# Altium project RF_Tetra.PrjPcb (part 3 of 7)

## Sheet CLOC_DISTR.SchDoc: Clock distributions
size A3; SheetNumber: 4; SheetTotal: 17
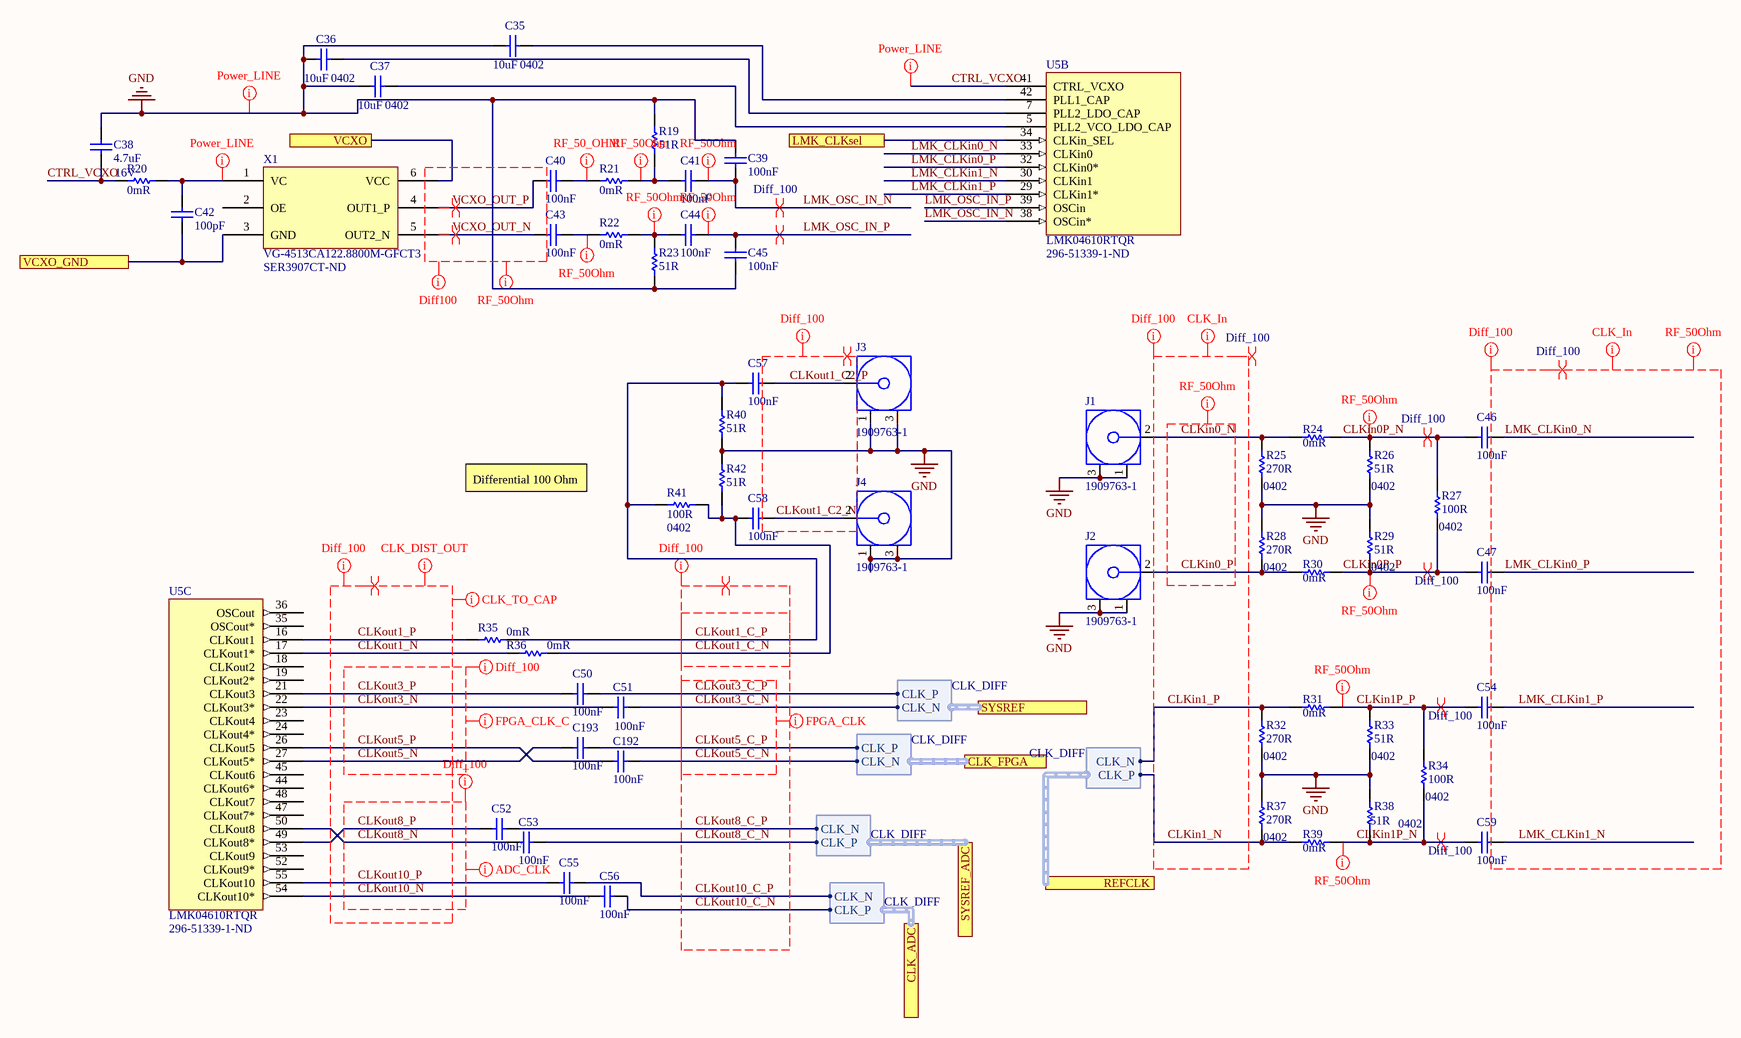
[diagram p4: CLOC_DISTR.SchDoc]

### Parts
C35  10uF  Case/Package: 0402  [CAP 0402/1005 RF KK]
C36  10uF  Case/Package: 0402  [CAP 0402/1005 RF KK]
C37  10uF  Case/Package: 0402  [CAP 0402/1005 RF KK]
C38  4.7uF  Voltage: 16V  [CAP 0603/1608 RF]
C39  100nF  [CAP 0201/0603 KK]
C40  100nF  [CAP 0201/0603 KK]
C41  100nF  [CAP 0201/0603 KK]
C42  100pF  [CAP 0402/1005 RF KK]
C43  100nF  [CAP 0201/0603 KK]
C44  100nF  [CAP 0201/0603 KK]
C45  100nF  [CAP 0201/0603 KK]
C46  100nF  [CAP 0201/0603 KK]
C47  100nF  [CAP 0201/0603 KK]
C50  100nF  [CAP 0201/0603 KK]
C51  100nF  [CAP 0201/0603 KK]
C52  100nF  [CAP 0201/0603 KK]
C53  100nF  [CAP 0201/0603 KK]
C54  100nF  [CAP 0201/0603 KK]
C55  100nF  [CAP 0201/0603 KK]
C56  100nF  [CAP 0201/0603 KK]
C57  100nF  [CAP 0201/0603 KK]
C58  100nF  [CAP 0201/0603 KK]
C59  100nF  [CAP 0201/0603 KK]
C192  100nF  [CAP 0201/0603 KK]
C193  100nF  [CAP 0201/0603 KK]
J1  1909763-1  [TECO-1909763-1_V]
J2  1909763-1  [TECO-1909763-1_V]
J3  1909763-1  [TECO-1909763-1_V]
J4  1909763-1  [TECO-1909763-1_V]
R19  51R  [RES 0402/1005 RF KK]
R20  0mR  [RES 0402/1005 RF KK]
R21  0mR  [RES 0402/1005 RF KK]
R22  0mR  [RES 0402/1005 RF KK]
R23  51R  [RES 0402/1005 RF KK]
R24  0mR  [RES 0402/1005 RF KK]
R25  270R  Case/Package: 0402  [RES 0402/1005 RF KK]
R26  51R  Case/Package: 0402  [RES 0402/1005 RF KK]
R27  100R  Case/Package: 0402  [RES 0402/1005 RF KK]
R28  270R  Case/Package: 0402  [RES 0402/1005 RF KK]
R29  51R  Case/Package: 0402  [RES 0402/1005 RF KK]
R30  0mR  [RES 0402/1005 RF KK]
R31  0mR  [RES 0402/1005 RF KK]
R32  270R  Case/Package: 0402  [RES 0402/1005 RF KK]
R33  51R  Case/Package: 0402  [RES 0402/1005 RF KK]
R34  100R  Case/Package: 0402  [RES 0402/1005 RF KK]
R35  0mR  [RES 0402/1005 RF KK]
R36  0mR  [RES 0402/1005 RF KK]
R37  270R  Case/Package: 0402  [RES 0402/1005 RF KK]
R38  51R  Case/Package: 0402  [RES 0402/1005 RF KK]
R39  0mR  [RES 0402/1005 RF KK]
R40  51R  [RES 0402/1005 RF KK]
R41  100R  Case/Package: 0402  [RES 0402/1005 RF KK]
R42  51R  [RES 0402/1005 RF KK]
U5  LMK04610RTQR  Supplier Part Number 1: 296-51339-1-ND  [LMK04610]  (parts B,C of 4)
X1  VG-4513CA122.8800M-GFCT3  Supplier Part Number 1: SER3907CT-ND  [VG-4513CA]

### Ports
CLK_ADC (harness CLK_DIFF), CLK_FPGA (harness CLK_DIFF), LMK_CLKsel, REFCLK (harness CLK_DIFF), SYSREF (harness CLK_DIFF), SYSREF_ADC (harness CLK_DIFF), VCXO, VCXO_GND

### Harnesses
CLK_DIFF: CLK_N, CLK_P
CLK_DIFF: CLK_P, CLK_N

### Nets
GND: C35.1 C36.1 C37.1 C38.2 C39.2 C45.1 J1.1 J1.3 J2.1 J2.3 J3.1 J3.3 J4.1 J4.3 R19.2 R23.1 R25.1 R26.1 R28.2 R29.2 R32.1 R33.1 R37.2 R38.2 R40.1 R42.1
CLKin0_N: J1.2 R24.1 R25.2
CLKin0_P: J2.2 R28.1 R30.1
CLKin0P_N: C46.2 R24.2 R26.2 R27.2
CLKin0P_P: C47.2 R27.1 R29.1 R30.2
CLKin1_N: R37.1 R39.1 ; port REFCLK.CLK_P
CLKin1_P: R31.1 R32.2 ; port REFCLK.CLK_N
CLKin1P_N: C59.2 R34.1 R38.1 R39.2
CLKin1P_P: C54.2 R31.2 R33.2 R34.2
CLKout1_C2_N: C58.1 J4.2
CLKout1_C2_P: C57.1 J3.2
CLKout1_C_N: C58.2 R36.2 R41.2 R42.2
CLKout1_C_P: C57.2 R35.2 R40.2 R41.1
CLKout1_N: R36.1 U5.17(CLKout1*)
CLKout1_P: R35.1 U5.16(CLKout1)
CLKout3_C_N: C51.1 ; port SYSREF.CLK_N
CLKout3_C_P: C50.1 ; port SYSREF.CLK_P
CLKout3_N: C51.2 U5.22(CLKout3*)
CLKout3_P: C50.2 U5.21(CLKout3)
CLKout5_C_N: C192.1 ; port CLK_FPGA.CLK_N
CLKout5_C_P: C193.1 ; port CLK_FPGA.CLK_P
CLKout5_N: C193.2 U5.27(CLKout5*)
CLKout5_P: C192.2 U5.26(CLKout5)
CLKout8_C_N: C53.1 ; port SYSREF_ADC.CLK_P
CLKout8_C_P: C52.1 ; port SYSREF_ADC.CLK_N
CLKout8_N: C53.2 U5.50(CLKout8)
CLKout8_P: C52.2 U5.49(CLKout8*)
CLKout10_C_N: C56.1 ; port CLK_ADC.CLK_P
CLKout10_C_P: C55.1 ; port CLK_ADC.CLK_N
CLKout10_N: C56.2 U5.54(CLKout10*)
CLKout10_P: C55.2 U5.55(CLKout10)
CTRL_VCXO: C38.1 R20.1 U5.41(CTRL_VCXO)
GND_VCXO: C42.1 X1.3(GND) ; port VCXO_GND
LMK_CLKin0_N: C46.1 U5.33(CLKin0)
LMK_CLKin0_P: C47.1 U5.32(CLKin0*)
LMK_CLKin1_N: C59.1 U5.30(CLKin1)
LMK_CLKin1_P: C54.1 U5.29(CLKin1*)
LMK_CLKsel: U5.34(CLKin_SEL) ; port LMK_CLKsel
LMK_OSC_IN_N: C39.1 C41.1 U5.38(OSCin*)
LMK_OSC_IN_P: C44.1 C45.2 U5.39(OSCin)
VCXO_OUT_N: C43.2 X1.5(OUT2_N)
VCXO_OUT_P: C40.2 X1.4(OUT1_P)
NetC35_2: C35.2 U5.42(PLL1_CAP)
NetC36_2: C36.2 U5.7(PLL2_LDO_CAP)
NetC37_2: C37.2 U5.5(PLL2_VCO_LDO_CAP)
NetC40_1: C40.1 R21.1
NetC41_2: C41.2 R19.1 R21.2
NetC42_2: C42.2 R20.2 X1.1(VC)
NetC43_1: C43.1 R22.1
NetC44_2: C44.2 R22.2 R23.2
NetC111_2: X1.6(VCC) ; port VCXO

Not connected (* = marked no-connect by the designer): U5 18(CLKout2) 19(CLKout2*) 23(CLKout4) 24(CLKout4*) 35(OSCout*) 36(OSCout) 44(CLKout6*) 45(CLKout6) 47(CLKout7*) 48(CLKout7) 52(CLKout9*) 53(CLKout9); X1 2(OE)

### Layout directives
differential pair; differential pair class Diff_100: CLKin0_N, CLKin0_P, CLKin0P_N, CLKin0P_P, CLKin1_N, CLKin1_P, CLKin1P_N, CLKin1P_P, CLKout1_C2_N, CLKout1_C2_P, CLKout1_C_N, CLKout1_C_P, CLKout1_N, CLKout1_P, CLKout3_C_N, CLKout3_C_P, CLKout3_N, CLKout3_P, CLKout5_C_N, CLKout5_C_P, CLKout5_N, CLKout5_P, CLKout8_C_N, CLKout8_C_P, CLKout8_N, CLKout8_P, CLKout10_C_N, CLKout10_C_P, CLKout10_N, CLKout10_P, LMK_CLKin0_N, LMK_CLKin0_P, LMK_CLKin1_N, LMK_CLKin1_P, LMK_OSC_IN_N, LMK_OSC_IN_P, VCXO_OUT_N, VCXO_OUT_P
net class CLK_In1: CLKin0_N, CLKin0_P, CLKin1_N, CLKin1_P
net class Single50: CLKin0_N, CLKin0_P, CLKin0P_N, CLKin0P_P, CLKin1P_N, CLKin1P_P, LMK_CLKin0_N, LMK_CLKin0_P, LMK_CLKin1_N, LMK_CLKin1_P, LMK_OSC_IN_N, LMK_OSC_IN_P, NetC40_1, NetC41_2, NetC43_1, NetC44_2, VCXO_OUT_N, VCXO_OUT_P
net class CLK_In2: LMK_CLKin0_N, LMK_CLKin0_P, LMK_CLKin1_N, LMK_CLKin1_P
net class Diff_100: CLKin0_N, CLKin0_P, CLKin1_N, CLKin1_P, CLKout1_C2_N, CLKout1_C2_P, CLKout1_C_N, CLKout1_C_P, CLKout1_N, CLKout1_P, CLKout3_C_N, CLKout3_C_P, CLKout3_N, CLKout3_P, CLKout5_C_N, CLKout5_C_P, CLKout5_N, CLKout5_P, CLKout8_C_N, CLKout8_C_P, CLKout8_N, CLKout8_P, CLKout10_C_N, CLKout10_C_P, CLKout10_N, CLKout10_P, LMK_CLKin0_N, LMK_CLKin0_P, LMK_CLKin1_N, LMK_CLKin1_P, VCXO_OUT_N, VCXO_OUT_P
net class Power_LINE: CTRL_VCXO, GND, NetC42_2
net class CLK_DIST_OUT: CLKout1_N, CLKout1_P, CLKout3_N, CLKout3_P, CLKout5_N, CLKout5_P, CLKout8_N, CLKout8_P, CLKout10_N, CLKout10_P
net class CLK_TO_CAP: CLKout1_N, CLKout1_P, CLKout3_N, CLKout3_P, CLKout5_N, CLKout5_P, CLKout8_N, CLKout8_P, CLKout10_N, CLKout10_P
net class FPGA_CLK: CLKout3_C_N, CLKout3_C_P, CLKout5_C_N, CLKout5_C_P
net class ADC_CLK: CLKout8_N, CLKout8_P, CLKout10_N, CLKout10_P
net class FPGA_CLK_C: CLKout3_N, CLKout3_P, CLKout5_N, CLKout5_P

### Notes on the sheet
- Differential 100 Ohm
- Title
- Size:
- Date:
- A3
- Number:
- Time:
- Revision:
- Sheet
- of
- File:

### Library data of the parts
C35-C37 = Capacitor: CAP CER 10UF 6.3V X5R 0402; Manufacturer: Murata; Manufacturer Part Number: GRJ155R60J106ME11D; Tolerance: 20%; Supplier 1: Digi-Key; Supplier Part Number 1: 490-13211-1-ND; RoHS: Yes; Category: Ceramic Capacitors; Stock 1: 1136490; Pricing 1: 1=0,21000, 10=0,14500, 50=0,08680, 100=0,07330, 500=0,05016, 1000=0,04436, 2500=0,04244, 5000=0,03858 (USD); Mount: Surface Mount; Case Code (Metric): 1005; Case Code (Imperial): 0402; Min Operating Temperature: -55°C; Max Operating Temperature: 85°C; Packaging: Cut Tape; Capacitance: 10uF; Voltage Rating: 6.3V; Features: Soft Termination; Length: 0.039inch; Width: 0.02inch; Thickness: 0.028inch; ComponentLink1URL: http://psearch.en.murata.com/capacitor/product/GRJ155R60J106ME11%23.pdf?src-supplier=Digi-Key; ComponentLink1Description: http://psearch.en.murata.com/capacitor/product/GRJ155R60J106ME11%23.pdf?src-supplier=Digi-Key
C38 = Capacitor: TAIYO YUDEN - EMK107ABJ475MA-T - SMD Multilayer Ceramic Capacitor, 4.7 µF, 16 V, 0603 [1608 Metric], ± 20%, X5R, M Series; Supplier 1: Digi-Key; Supplier Part Number 1: 587-6003-1-ND; Manufacturer: Taiyo Yuden; Manufacturer Part Number: EMK107ABJ475MA-T; RoHS: Yes; Category: Ceramic Capacitors; Stock 1: 5; Pricing 1: 1=0,28000, 10=0,19200, 50=0,12820, 100=0,10900, 500=0,07696, 1000=0,06734 (USD); Mount: Surface Mount; Case/Package: Ceramic; Min Operating Temperature: -55°C; Max Operating Temperature: 85°C; Capacitance: 4.7uF; Tolerance: 20%; Packaging: Tape and Reel; Dielectric: X5R; Length: 1.6mm; Height: 0.8mm; Depth: 0.8mm; Radiation Hardening: No; Lead Free: Lead Free; ComponentLink1URL: https://datasheet.ciiva.com/26871/getdatasheetpartid-637315-26871304.pdf?src-supplier=Verical; ComponentLink1Description: https://datasheet.ciiva.com/26871/getdatasheetpartid-637315-26871304.pdf?src-supplier=Verical
C39 C45 = Capacitor: Manufacturer 1: Yageo; Manufacturer Part Number 1: CC0201KRX5R6BB104; Voltage Rating (DC): 10V; Tolerance: 10%; Dielectric: X5R; Supplier 1: Digi-Key; Supplier Part Number 1: 311-1593-1-ND; Stock 1: 1229391; Pricing 1: 1=0.10000, 10=0.03800, 100=0.01690, 500=0.01208, 1000=0.00949, 2500=0.00862, 5000=0.00794 (USD); RoHS: Yes; Mount: Surface Mount; Case/Package: 0201; Weight: 6E-06oz; Case Code (Imperial): 0201; Case Code (Metric): 0603; Min Operating Temperature: -55°C; Max Operating Temperature: 85°C; Capacitance: 100nF; Packaging: Tape and Reel; Termination: SMD/SMT; Composition: Ceramic; Voltage Rating: 10V; Length: 0.6mm; Height: 0.3mm; Width: 0.012inch; Thickness: 0.013inch; Depth: 0.3mm; Radiation Hardening: No; Lead Free: Lead Free; Halogen Free: Halogen Free; ComponentLink1URL: https://datasheet.ciiva.com/17437/upy-gphc-x5r-4v-to-50v-12-17437495.pdf?src-supplier=Avnet+Europe; ComponentLink1Description: https://datasheet.ciiva.com/17437/upy-gphc-x5r-4v-to-50v-12-17437495.pdf?src-supplier=Avnet+Europe; ComponentLink2URL: https://datasheet.ciiva.com/11587/upy-gphc-x5r-4v-to-50v-12-11587190.pdf?src-supplier=Avnet; ComponentLink2Description: https://datasheet.ciiva.com/11587/upy-gphc-x5r-4v-to-50v-12-11587190.pdf?src-supplier=Avnet
C40 C41 C43 C44 C46 C47 C50-C59 C192 C193 = Capacitor: Manufacturer 1: Murata; Manufacturer Part Number 1: GRM033R61C104ME84D; Voltage Rating: 16V; Tolerance: 20%; Dielectric: X5R; Supplier 1: Digi-Key; Supplier Part Number 1: 490-9986-1-ND; Stock 1: 503570; Pricing 1: 1=0.10000, 10=0.05400, 100=0.02430, 500=0.01732, 1000=0.01361, 2500=0.01238, 5000=0.01139 (USD); RoHS: Yes; Mount: Surface Mount; Case/Package: 0201; Weight: 1.2E-05oz; Case Code (Metric): 0603; Case Code (Imperial): 0201; Min Operating Temperature: -55°C; Max Operating Temperature: 85°C; Capacitance: 100nF; Packaging: Tape and Reel; Termination: SMD/SMT; Voltage Rating (DC): 16V; Package Quantity: 15000; Length: 0.024inch; Height: 0.3mm; Width: 0.3mm; Thickness: 0.013inch; ComponentLink1URL: http://www.mouser.com/ds/2/281/c02e-2905.pdf?src-supplier=Mouser; ComponentLink1Description: http://www.mouser.com/ds/2/281/c02e-2905.pdf?src-supplier=Mouser; ComponentLink2URL: http://search.murata.co.jp/Ceramy/image/img/A01X/G101/ENG/GRM033R61C104ME84-01.pdf?src-supplier=Digi-Key; ComponentLink2Description: http://search.murata.co.jp/Ceramy/image/img/A01X/G101/ENG/GRM033R61C104ME84-01.pdf?src-supplier=Digi-Key
C42 = Capacitor: Manufacturer 1: KEMET; Manufacturer Part Number 1: C0402C101J5GACAUTO; Dielectric Material: Ceramic; Tolerance: 5%; Voltage Rating: 50V; Dielectric: C0G; Supplier 1: Digi-Key; Supplier Part Number 1: 399-6823-1-ND; Stock 1: 66452; Pricing 1: 1=0.11000, 10=0.08400, 100=0.03730, 500=0.02664, 1000=0.02093, 2500=0.01903, 5000=0.01751 (USD); RoHS: Yes; Mount: Surface Mount; Case/Package: 0402; Case Code (Metric): 1005; Case Code (Imperial): 0402; Min Operating Temperature: -55°C; Max Operating Temperature: 125°C; Package Quantity: 10000; Capacitance: 100pF; Packaging: Tape and Reel; Voltage Rating (DC): 50V; Length: 1mm; Width: 0.02inch; Thickness: 0.022inch; Depth: 0.5mm; Ratings: AEC-Q200; Radiation Hardening: No; REACH SVHC: No SVHC; Lead Free: Lead Free; ComponentLink1URL: https://datasheet.ciiva.com/26923/getdatasheetpartid-385375-26923866.pdf?src-supplier=Verical; ComponentLink1Description: https://datasheet.ciiva.com/26923/getdatasheetpartid-385375-26923866.pdf?src-supplier=Verical
J1-J4 = 1909763-1: Ultra Miniature Coaxial Connector Jack, 60 V, 50 Ohm, -40 to 90 degC, RoHS, Tape and Reel; Brand: TE Connectivity / AMP; Maximum Frequency: 6 GHz; Gender: Jack (Female); Body Material: Liquid Crystal Polymer (LCP); RF Series: UMCC; Impedance: 50 Ohms; DatasheetVersion: Rev. B2; PackageReference: SMD; PackageDescription: 3-Pin Surface Mount Device, Body 2.6 x 2.6 mm; Supplier 1: Newark; Supplier Part Number 1: 62X0488; Supplier 2: Farnell; Supplier Part Number 2: 2781689; Supplier 3: Digi-Key; Supplier Part Number 3: A118077TR-ND; Supplier 4: Digi-Key; Supplier Part Number 4: A118077CT-ND; Supplier 5: Digi-Key; Supplier Part Number 5: A118077DKR-ND; Product Category: RF Connectors / Coaxial Connectors; Packaging: Reel; Product: Connectors; Orientation: Straight; Operating Temperature Range: - 40 C to + 90 C; Factory Pack Quantity: 5000; RoHS: Details; Contact Plating: Gold; Contact Material: Copper Alloy; Mounting Technology: Surface Mount; ComponentLink1Description: Manufacturer URL; ComponentLink1URL: http://www.te.com; ComponentLink2Description: Datasheet; ComponentLink2URL: http://www.te.com/commerce/DocumentDelivery/DDEController?Action=srchrtrv&DocNm=1909763&DocType=Customer+Drawing&DocLang=English
R19 R23 R40 R42 = Resistor: Manufacturer 1: Susumu; Manufacturer Part Number 1: RR0510R-510-D; Tolerance: 0.5%; Power Rating: 63mW; Voltage Rating: 25V; Temperature Coefficient: 100ppm/°C; Supplier 1: Digi-Key; Supplier Part Number 1: RR05R51DCT-ND; Stock 1: 85168; Pricing 1: 1=0.10000, 10=0.07400, 100=0.02850, 1000=0.01254, 2500=0.01083, 5000=0.00969 (USD); RoHS: Yes; Case/Package: 0402; Number of Pins: 2; Case Code (Metric): 1005; Case Code (Imperial): 0402; Min Operating Temperature: -55°C; Max Operating Temperature: 125°C; Resistance: 51R; Package Quantity: 1; Packaging: Tape and Reel; Composition: Thin Film; Number of Terminations: 2; Termination: SMD/SMT; Max Power Dissipation: 63mW; Voltage Rating (DC): 25V; Length: 0.039inch; Height: 0.016inch; Width: 0.02inch; REACH SVHC: Unknown; Lead Free: Lead Free; ComponentLink1URL: https://datasheet.ciiva.com/2486/rr-data-sheet-2486920.pdf?src-supplier=Digi-Key; ComponentLink1Description: https://datasheet.ciiva.com/2486/rr-data-sheet-2486920.pdf?src-supplier=Digi-Key; ComponentLink2URL: https://datasheet.ciiva.com/2486/rr-data-sheet-2486921.pdf?src-supplier=Digi-Key; ComponentLink2Description: https://datasheet.ciiva.com/2486/rr-data-sheet-2486921.pdf?src-supplier=Digi-Key; ComponentLink3URL: https://datasheet.ciiva.com/2486/rr-data-sheet-2486922.pdf?src-supplier=Digi-Key; ComponentLink3Description: https://datasheet.ciiva.com/2486/rr-data-sheet-2486922.pdf?src-supplier=Digi-Key; ComponentLink4URL: https://datasheet.ciiva.com/28635/87330-28635919.pdf?src-supplier=Element14; ComponentLink4Description: https://datasheet.ciiva.com/28635/87330-28635919.pdf?src-supplier=Element14
R20-R22 R24 R30 R31 R35 R36 R39 = Resistor: YAGEO - RC0402JR-070RL. - RES, THICK FILM, 0R, 0.0625W, 0402; Power Rating: 62.5mW; Tolerance: 5%; Voltage Rating: 50V; Max Power Dissipation: 63mW; Temperature Coefficient: 200ppm/°C; Supplier 1: Digi-Key; Supplier Part Number 1: 311-0.0JRCT-ND; Manufacturer: Yageo; Manufacturer Part Number: RC0402JR-070RL; RoHS: Yes; Category: Chip SMD Resistors; Stock 1: 45338179; Pricing 1: 1=0,10000, 10=0,01200, 25=0,00920, 50=0,00680, 100=0,00510, 250=0,00388, 500=0,00310, 1000=0,00228, 5000=0,00163 (USD); Case/Package: 0402; Case Code (Metric): 1005; Case Code (Imperial): 0402; Contact Plating: Tin,Matte; Min Operating Temperature: -55°C; Max Operating Temperature: 155°C; Package Quantity: 1; Resistance: 0mR; Packaging: Tape and Reel; Resistor Type: Thick Film; Number of Terminations: 2; Termination: SMD/SMT; Features: Moisture Resistant; Length: 1mm; Height: 0.016inch; Width: 0.02inch; Depth: 0.5mm; Radiation Hardening: No; REACH SVHC: Unknown; Military Standard: Not; Lead Free: Lead Free; ComponentLink1URL: https://datasheet.ciiva.com/2452/pyu-rc0402-51-rohs-l-6-2452608.pdf?src-supplier=Digi-Key; ComponentLink1Description: https://datasheet.ciiva.com/2452/pyu-rc0402-51-rohs-l-6-2452608.pdf?src-supplier=Digi-Key; ComponentLink2URL: https://datasheet.ciiva.com/11808/0900766b80c66297-11808195.pdf?src-supplier=RSComponents; ComponentLink2Description: https://datasheet.ciiva.com/11808/0900766b80c66297-11808195.pdf?src-supplier=RSComponents; ComponentLink3URL: https://datasheet.ciiva.com/2452/pyu-r-int-thick-7-2452609.pdf?src-supplier=Digi-Key; ComponentLink3Description: https://datasheet.ciiva.com/2452/pyu-r-int-thick-7-2452609.pdf?src-supplier=Digi-Key; ComponentLink4URL: https://datasheet.ciiva.com/2452/pyu-r-int-thick-7-2452610.pdf?src-supplier=Digi-Key; ComponentLink4Description: https://datasheet.ciiva.com/2452/pyu-r-int-thick-7-2452610.pdf?src-supplier=Digi-Key; ComponentLink5URL: https://datasheet.ciiva.com/8896/pyu-rc0402-51-rohs-l-6-8896201.pdf?src-supplier=Avnet; ComponentLink5Description: https://datasheet.ciiva.com/8896/pyu-rc0402-51-rohs-l-6-8896201.pdf?src-supplier=Avnet; ComponentLink6URL: https://datasheet.ciiva.com/28386/pyu-rc0402-51-rohs-l-6-28386633.pdf?src-supplier=Avnet+Europe; ComponentLink6Description: https://datasheet.ciiva.com/28386/pyu-rc0402-51-rohs-l-6-28386633.pdf?src-supplier=Avnet+Europe; ComponentLink7URL: https://datasheet.ciiva.com/22747/1018594-22747515.pdf?src-supplier=Element14; ComponentLink7Description: https://datasheet.ciiva.com/22747/1018594-22747515.pdf?src-supplier=Element14; ComponentLink8URL: https://datasheet.ciiva.com/15189/getdatasheetpartid-326379-15189533.pdf?src-supplier=Verical; ComponentLink8Description: https://datasheet.ciiva.com/15189/getdatasheetpartid-326379-15189533.pdf?src-supplier=Verical
R25 R28 R32 R37 = Resistor: RESISTOR, METAL FILM, 270 OHM, 0.5%,0402; Manufacturer: Panasonic; Manufacturer Part Number: ERA-2AED271X; Temperature Coefficient: 25ppm/°C; Voltage Rating (DC): 25V; Max Power Dissipation: 63mW; Power Rating: 62.5mW; Supplier 1: Digi-Key; Supplier Part Number 1: P270DECT-ND; RoHS: Yes; Category: Chip SMD Resistors; Stock 1: 15767; Pricing 1: 1=0,21000, 10=0,17900, 100=0,07000, 1000=0,02930, 2500=0,02686, 5000=0,02442 (USD); Mount: Surface Mount; Contact Plating: Tin; Case Code (Imperial): 0402; Case Code (Metric): 1005; Min Operating Temperature: -55°C; Max Operating Temperature: 155°C; Features: Automotive AEC-Q200; Termination: SMD/SMT; Composition: Thin Film,Metal Film; Number of Terminations: 2; Resistance: 270R; Packaging: Tape and Reel; Tolerance: 0.5%; Package Quantity: 10000; Voltage Rating: 25V; Length: 0.039inch; Height: 0.016inch; Width: 0.02inch; Lead Free: Lead Free; REACH SVHC: No SVHC; ComponentLink1URL: https://datasheet.ciiva.com/9183/aoa0000ce26-9183624.pdf?src-supplier=Avnet; ComponentLink1Description: https://datasheet.ciiva.com/9183/aoa0000ce26-9183624.pdf?src-supplier=Avnet; ComponentLink2URL: https://datasheet.ciiva.com/46378/1776116-46378222.pdf?src-supplier=Element14; ComponentLink2Description: https://datasheet.ciiva.com/46378/1776116-46378222.pdf?src-supplier=Element14
R26 R29 R33 R38 = Resistor: RES SMD 51 OHM 0.5% 1/16W 0402; Manufacturer: Panasonic; Manufacturer Part Number: ERA-2AED510X; Temperature Coefficient: 25ppm/°C; Power Rating: 62.5mW; Max Power Dissipation: 63mW; Supplier 1: Digi-Key; Supplier Part Number 1: P51DECT-ND; RoHS: Yes; Category: Chip SMD Resistors; Stock 1: 20961; Pricing 1: 1=0,21000, 10=0,17900, 100=0,07000, 1000=0,02930, 2500=0,02686, 5000=0,02442 (USD); Mount: Surface Mount; Case Code (Metric): 1005; Case Code (Imperial): 0402; Contact Plating: Tin; Min Operating Temperature: -55°C; Max Operating Temperature: 155°C; Features: Automotive AEC-Q200; Resistance: 51R; Tolerance: 0.5%; Packaging: Tape and Reel; Package Quantity: 1; Composition: Thin Film,Metal Film; Number of Terminations: 2; Military Standard: Not; Length: 1mm; Height: 0.016inch; Depth: 0.5mm; Width: 0.02inch; Lead Free: Lead Free; ComponentLink1URL: https://datasheet.ciiva.com/9189/aoa0000ce26-9189082.pdf?src-supplier=Avnet; ComponentLink1Description: https://datasheet.ciiva.com/9189/aoa0000ce26-9189082.pdf?src-supplier=Avnet
R27 R34 R41 = Resistor: YAGEO - RC0402FR-07100RL. - RES, THICK FILM, 100R, 1%, 0.0625W, 0402, REEL; Temperature Coefficient: 100ppm/°C; Power Rating: 62.5mW; Voltage Rating: 50V; Supplier 1: Digi-Key; Supplier Part Number 1: 311-100LRCT-ND; Manufacturer: Yageo; Manufacturer Part Number: RC0402FR-07100RL; RoHS: Yes; Category: Chip SMD Resistors; Stock 1: 31356128; Pricing 1: 1=0,10000, 10=0,01600, 100=0,00640, 1000=0,00289, 2500=0,00251, 5000=0,00207 (USD); Number of Pins: 2; Case Code (Imperial): 0402; Case Code (Metric): 1005; Min Operating Temperature: -55°C; Max Operating Temperature: 155°C; Military Standard: Not; Tolerance: 1%; Resistance: 100R; Packaging: Tape and Reel; Termination: SMD/SMT; Composition: Thick Film; Voltage Rating (DC): 50V; Length: 1mm; Height: 0.32mm; Depth: 0.5mm; Width: 0.5mm; Lead Free: Lead Free; REACH SVHC: No SVHC; ComponentLink1URL: https://datasheet.ciiva.com/7849/1784430-7849810.pdf?src-supplier=Element14; ComponentLink1Description: https://datasheet.ciiva.com/7849/1784430-7849810.pdf?src-supplier=Element14; ComponentLink2URL: https://datasheet.ciiva.com/11808/0900766b80c66297-11808765.pdf?src-supplier=RSComponents; ComponentLink2Description: https://datasheet.ciiva.com/11808/0900766b80c66297-11808765.pdf?src-supplier=RSComponents; ComponentLink3URL: https://datasheet.ciiva.com/16740/pyu-rc0402-51-rohs-l-6-r-16740566.pdf?src-supplier=Future+Electronics; ComponentLink3Description: https://datasheet.ciiva.com/16740/pyu-rc0402-51-rohs-l-6-r-16740566.pdf?src-supplier=Future+Electronics; ComponentLink4URL: https://datasheet.ciiva.com/15189/getdatasheetpartid-329466-15189335.pdf?src-supplier=Verical; ComponentLink4Description: https://datasheet.ciiva.com/15189/getdatasheetpartid-329466-15189335.pdf?src-supplier=Verical; ComponentLink5URL: https://datasheet.ciiva.com/28367/1018594-28367226.pdf?src-supplier=Element14; ComponentLink5Description: https://datasheet.ciiva.com/28367/1018594-28367226.pdf?src-supplier=Element14; ComponentLink6URL: https://datasheet.ciiva.com/12667/pyu-rc0402-51-rohs-l-6-r-12667957.pdf?src-supplier=Mouser; ComponentLink6Description: https://datasheet.ciiva.com/12667/pyu-rc0402-51-rohs-l-6-r-12667957.pdf?src-supplier=Mouser; ComponentLink7URL: https://datasheet.ciiva.com/22747/1018594-22747511.pdf?src-supplier=Element14; ComponentLink7Description: https://datasheet.ciiva.com/22747/1018594-22747511.pdf?src-supplier=Element14
U5 = LMK04610RTQR: LMK04610RTQT; Manufacturer: Texas Instruments; Number of Inputs: 2; Number of Outputs: 10; PLL: Yes; Input: LVCMOS; Number of Circuits: 1; Max Frequency: 6.175GHz; Supplier 1: Digi-Key; Manufacturer Part Number: LMK04610RTQR; Stock 1: 2022; Pricing 1: 1 = 20,47000, 10 = 18,87700, 100 = 16,11940, 500 = 14,63474 (USD); RoHS: No; Min Operating Temperature: -40°C; Max Operating Temperature: 85°C; Supplier 2: Digi-Key; Supplier Part Number 2: 296-48594-1-ND; Category: Clock Generators, PLLs, Frequency Synthesizers; Stock 2: 150; Pricing 2: 1=32,35000, 10=29,84000, 25=28,49880, 100=25,48130 (USD); Mount: Surface Mount; Case/Package: QFN; Packaging: Tape and Reel; ComponentLink1URL: http://www.ti.com/lit/ds/symlink/lmk04610.pdf?src-supplier=Digi-Key; ComponentLink1Description: http://www.ti.com/lit/ds/symlink/lmk04610.pdf?src-supplier=Digi-Key
X1 = VG-4513CA122.8800M-GFCT3: OSC VCXO 122.88MHZ LVPECL SMD; Manufacturer: Epson; Max Supply Current: 65mA; Supplier 1: Digi-Key; Manufacturer Part Number: VG-4513CA122.8800M-GFCT3; Stock 1: 438; Pricing 1: 1 = 9,91000, 10 = 9,29000, 50 = 8,97980, 100 = 8,67020 (USD); RoHS: Yes; Mount: Surface Mount; Case/Package: SMD/SMT; Min Operating Temperature: -40°C; Max Operating Temperature: 85°C; Packaging: Tape and Reel; Frequency: 122.88MHz; Length: 0.276inch; Height: 0.071inch; Width: 0.197inch; Lead Free: Lead Free; ComponentLink1URL: https://datasheet.ciiva.com/29626/vg-4513ca-partnumber-29626986.pdf?src-supplier=Digi-Key; ComponentLink1Description: https://datasheet.ciiva.com/29626/vg-4513ca-partnumber-29626986.pdf?src-supplier=Digi-Key; ComponentLink2URL: https://datasheet.ciiva.com/29626/vg-4513ca-partnumber-29626987.pdf?src-supplier=Digi-Key; ComponentLink2Description: https://datasheet.ciiva.com/29626/vg-4513ca-partnumber-29626987.pdf?src-supplier=Digi-Key; ComponentLink3URL: https://datasheet.ciiva.com/29626/076-vg-4513ca-cb-e13ya-29626988.pdf?src-supplier=Digi-Key; ComponentLink3Description: https://datasheet.ciiva.com/29626/076-vg-4513ca-cb-e13ya-29626988.pdf?src-supplier=Digi-Key

## Sheet RF_LANES.SchDoc
size A3
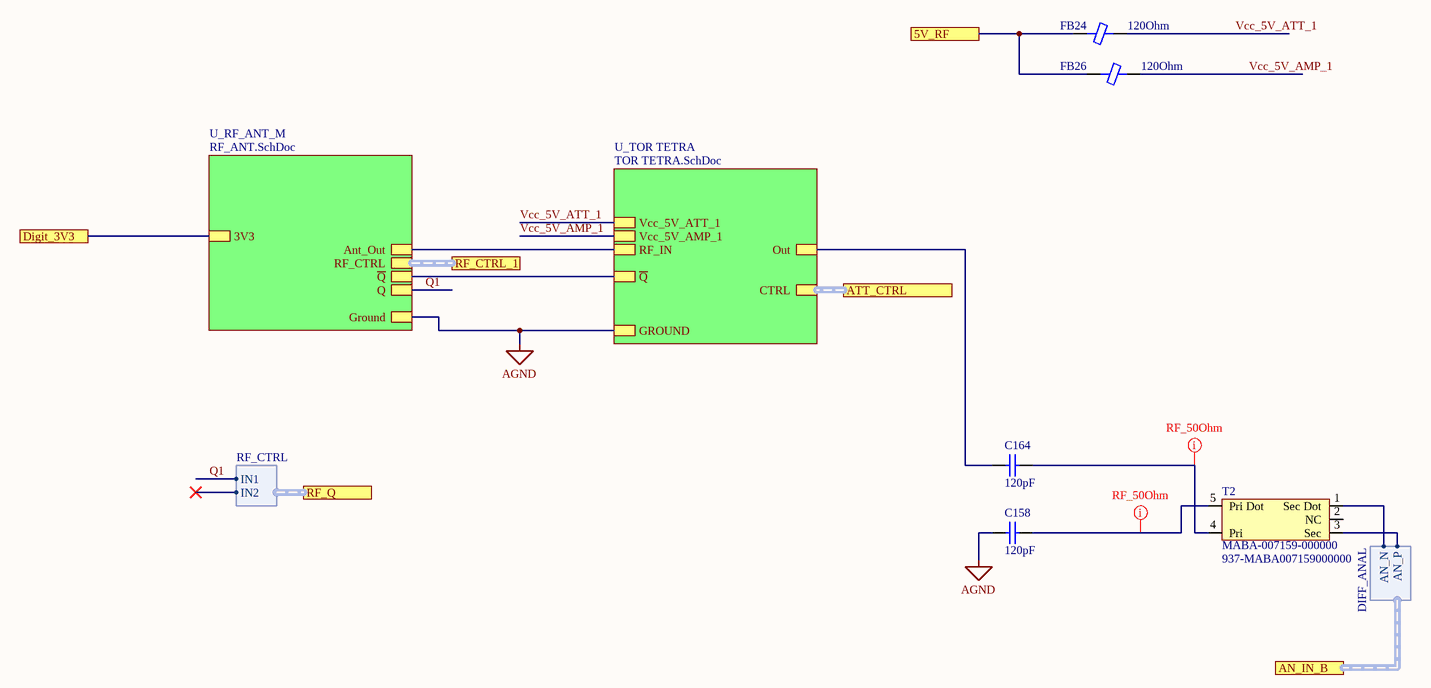
[diagram p5: RF_LANES.SchDoc]

### Parts
C158  120pF  [CAP 0402/1005 RF KK]
C164  120pF  [CAP 0402/1005 RF KK]
FB24  120Ohm  [FER 0402/1005]
FB26  120Ohm  [FER 0402/1005]
T2  MABA-007159-000000  Supplier Part Number 1: 937-MABA007159000000  [MABA-007159-000000]

### Sub-sheets
U_RF_ANT_M = RF_ANT.SchDoc: Ground, Ant_Out, ~{Q}, 3V3, Q, RF_CTRL (harness RF_CTRL)
U_TOR TETRA = TOR TETRA.SchDoc: Vcc_5V_ATT_1, Vcc_5V_AMP_1, GROUND, RF_IN, Out, CTRL (harness ATT_CTRL), ~{Q}

### Ports
5V_RF, AN_IN_B (harness DIFF_ANAL), ATT_CTRL (harness ATT_CTRL), Digit_3V3, RF_CTRL_1, RF_Q (harness RF_CTRL)

### Harnesses
DIFF_ANAL: AN_P, AN_N
RF_CTRL: IN1, IN2

### Nets
AGND: C158.1 ; sheet U_TOR TETRA/GROUND, sheet U_RF_ANT_M/Ground  [project net GND_ATT]
3V3_DIGIT: port Digit_3V3, sheet U_RF_ANT_M/3V3
5V: FB24.1 FB26.1 ; port 5V_RF
AIn_2122B_N: T2.1(Sec_Dot) ; port AN_IN_B.AN_N
AIn_2122B_P: T2.3(Sec) ; port AN_IN_B.AN_P
Q1: sheet U_RF_ANT_M/Q, port RF_Q.IN1  [project net Q]
~{Q}: sheet U_TOR TETRA/~{Q}, sheet U_RF_ANT_M/~{Q}
Vcc_5V_AMP_1: FB26.2 ; sheet U_TOR TETRA/Vcc_5V_AMP_1
Vcc_5V_ATT_1: FB24.2 ; sheet U_TOR TETRA/Vcc_5V_ATT_1
NetC158_2: C158.2 T2.5(Pri_Dot)
NetC164_1: C164.1 ; sheet U_TOR TETRA/Out
NetC164_2: C164.2 T2.4(Pri)
NetR45_2: sheet U_TOR TETRA/RF_IN, sheet U_RF_ANT_M/Ant_Out

Not connected (* = marked no-connect by the designer): T2 2(NC)

### Buses and harness runs
harness port ATT_CTRL = sheet U_TOR TETRA/CTRL
harness port RF_CTRL_1 = sheet U_RF_ANT_M/RF_CTRL

### Layout directives
net class Single50: NetC158_2, NetC164_2

### Notes on the sheet
- Title
- Size:
- Date:
- A3
- Number:
- Time:
- Revision:
- Sheet
- of
- File:

### Library data of the parts
C158 C164 = Capacitor: CAP CER 120PF 25V C0G/NP0 0402; Manufacturer: KEMET; Manufacturer Part Number: C0402C121J3GAC7867; Tolerance: 5%; Supplier 1: Digi-Key; Supplier Part Number 1: 399-14880-1-ND; RoHS: No; Category: Ceramic Capacitors; Stock 1: 43311; Pricing 1: 1=0,10000, 10=0,04100, 50=0,02260, 100=0,01840, 500=0,01312, 1000=0,01032, 2500=0,00938, 5000=0,00863 (USD); Mount: Surface Mount; Case/Package: 0402; Case Code (Imperial): 0402; Case Code (Metric): 1005; Min Operating Temperature: -55°C; Max Operating Temperature: 125°C; Packaging: Tape and Reel; Capacitance: 120pF; Voltage Rating: 25V; ComponentLink1URL: https://api.kemet.com/component-edge/download/datasheet/C0402C121J3GAC7867.pdf?src-supplier=Digi-Key; ComponentLink1Description: https://api.kemet.com/component-edge/download/datasheet/C0402C121J3GAC7867.pdf?src-supplier=Digi-Key
FB24 FB26 = Ferrite Chip: SMT Ferrite Chip; Value: 120Ohm; Supplier 1: Digi-Key; Supplier Part Number 1: 490-1008-1-ND
T2 = MABA-007159-000000: Manufacturer: TE Connectivity MA-COM; Turns Ratio: 1:1; Power Rating: 250mW; Max DC Current: 30mA; Lead/Base Style: Gull Wing; Supplier 1: Mouser; Manufacturer Part Number: MABA-007159-000000; Stock 1: 6455; Pricing 1: 1 = 1,75000, 10 = 1,41000, 50 = 1,41000, 100 = 1,13000, 1000 = 0,88000, 10000 = 0,68800 (USD); RoHS: Yes; Mount: Surface Mount; Case/Package: SMD/SMT; Number of Pins: 5; Min Operating Temperature: -40°C; Max Operating Temperature: 85°C; Packaging: Tape and Reel; Package Quantity: 2000; Termination: SMD/SMT; Length: 3.81mm; Height: 2.67mm; Width: 3.81mm; Depth: 3.81mm; Radiation Hardening: No; Lead Free: Lead Free; ComponentLink1URL: https://datasheet.ciiva.com/3295/maba-007159-000000-3295941.pdf?src-supplier=Avnet; ComponentLink1Description: https://datasheet.ciiva.com/3295/maba-007159-000000-3295941.pdf?src-supplier=Avnet; ComponentLink2URL: https://datasheet.ciiva.com/4550/maba-007159-000000-13414-4550885.pdf?src-supplier=Mouser; ComponentLink2Description: https://datasheet.ciiva.com/4550/maba-007159-000000-13414-4550885.pdf?src-supplier=Mouser; ComponentLink3URL: https://datasheet.ciiva.com/29655/maba-007159-000000-29655720.pdf?src-supplier=Digi-Key; ComponentLink3Description: https://datasheet.ciiva.com/29655/maba-007159-000000-29655720.pdf?src-supplier=Digi-Key; ComponentLink4URL: https://datasheet.ciiva.com/29655/maba-007159-000000-29655722.pdf?src-supplier=Digi-Key; ComponentLink4Description: https://datasheet.ciiva.com/29655/maba-007159-000000-29655722.pdf?src-supplier=Digi-Key

## Sheet TOR TETRA.SchDoc
size A3
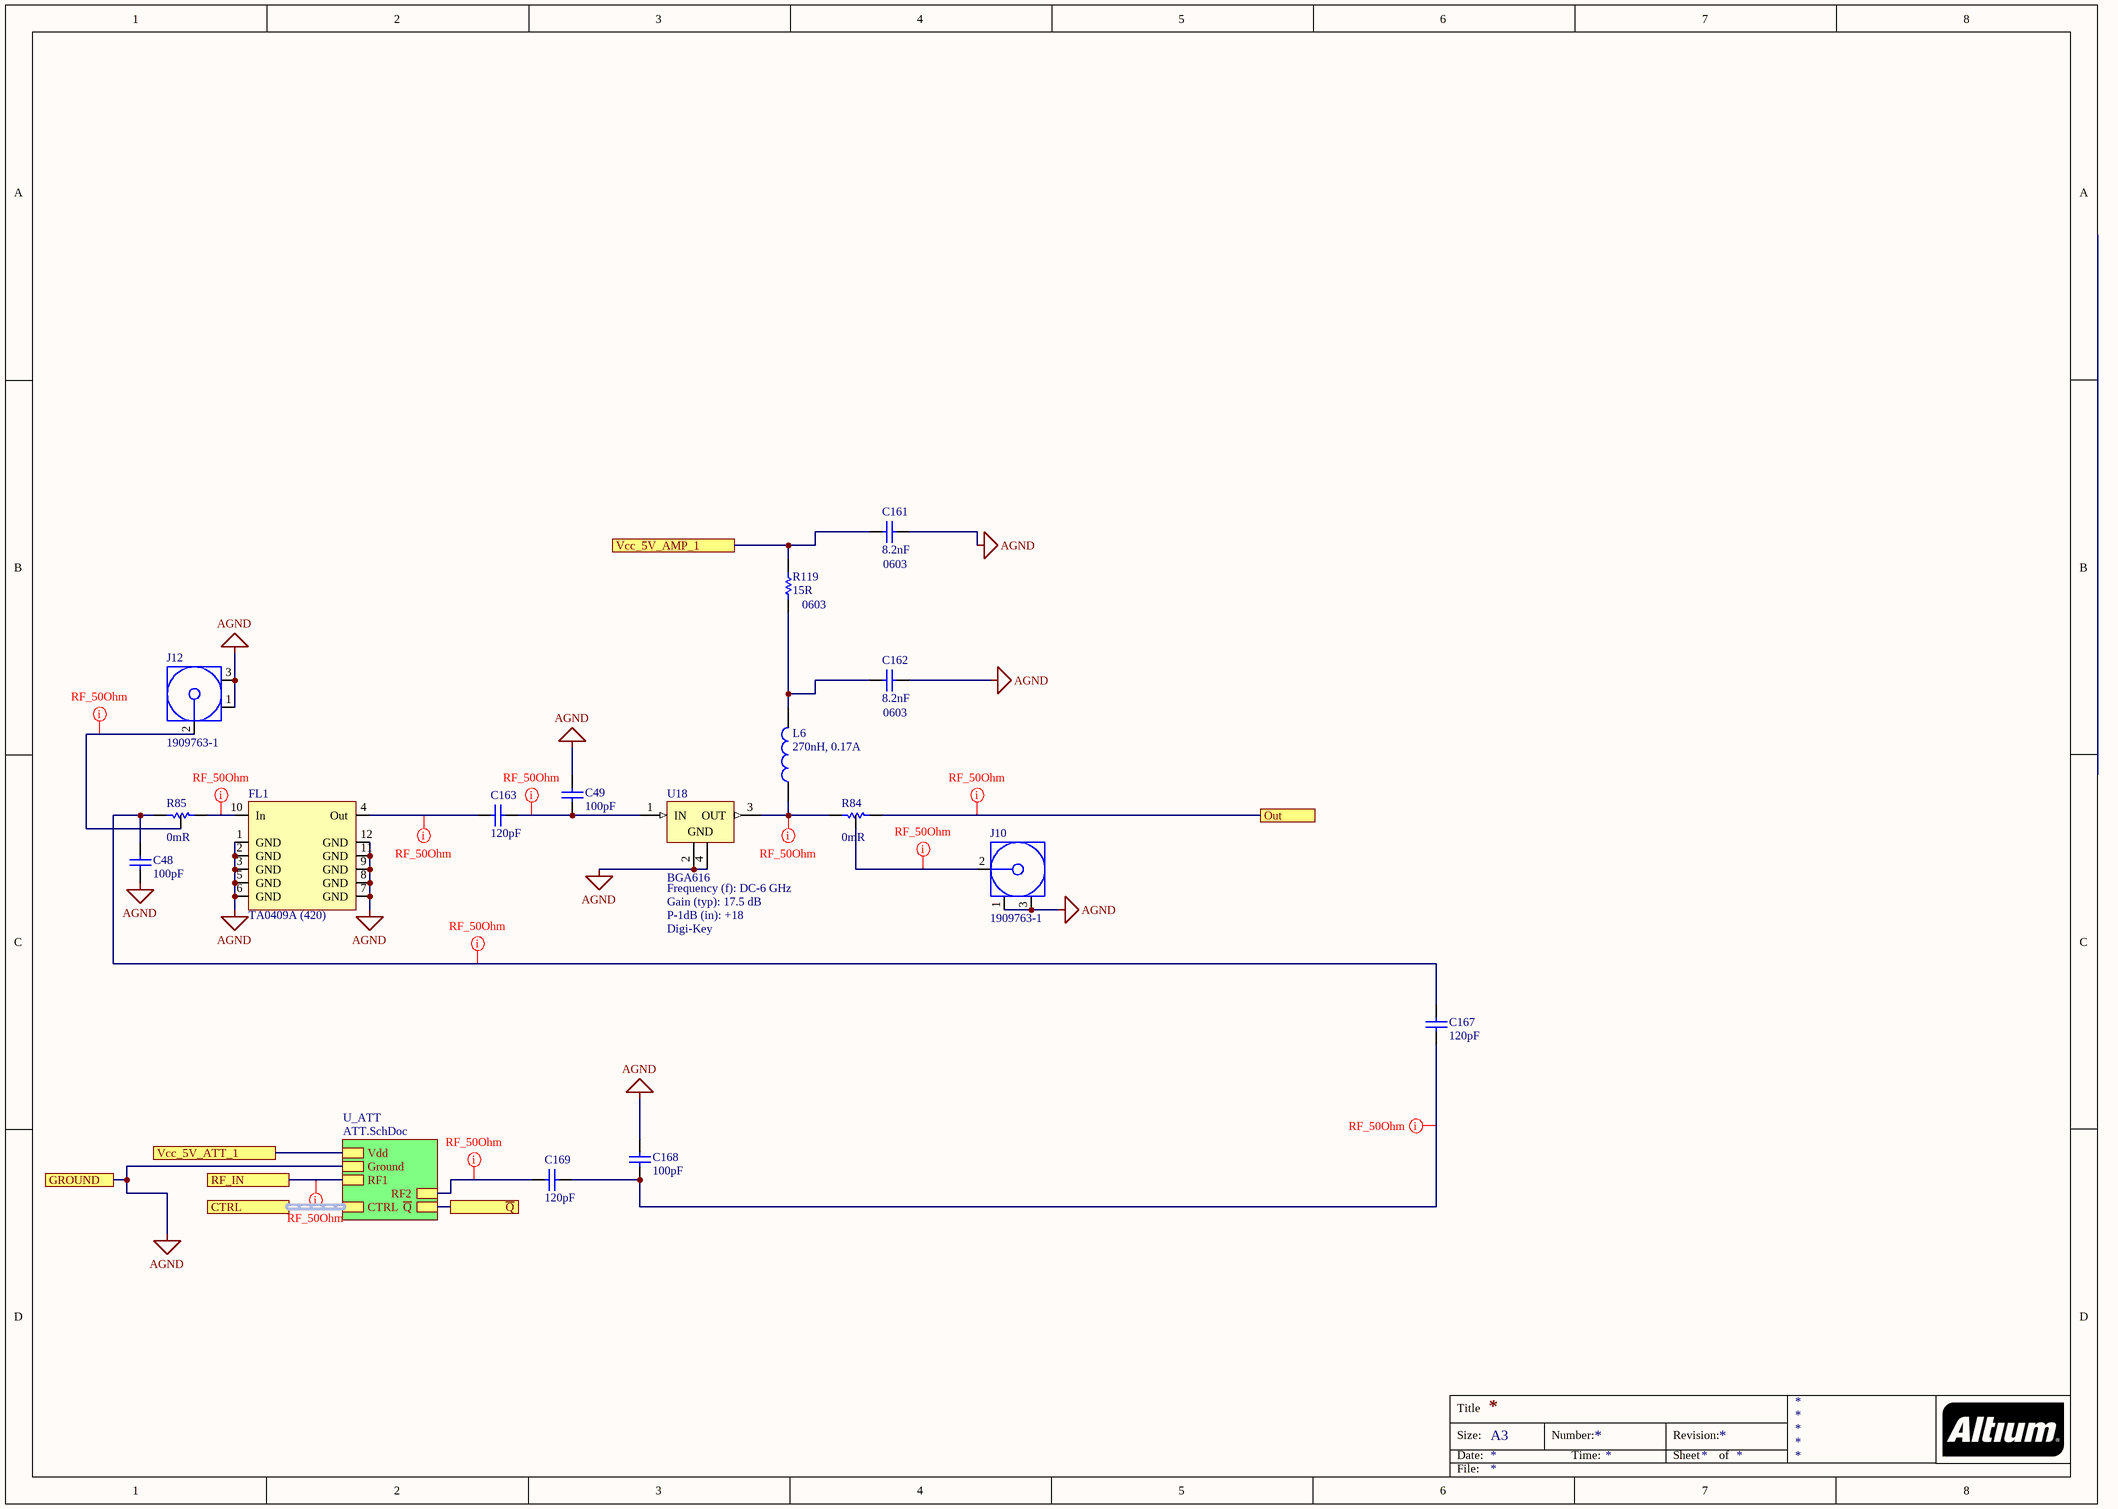
[diagram p6: TOR TETRA.SchDoc]

### Parts
C48  100pF  [CAP 0201/0603 KK]
C49  100pF  [CAP 0201/0603 KK]
C161  8.2nF  Case/Package: 0603  [CAP 0603/1608 RF]
C162  8.2nF  Case/Package: 0603  [CAP 0603/1608 RF]
C163  120pF  [CAP 0402/1005 RF KK]
C167  120pF  [CAP 0402/1005 RF KK]
C168  100pF  [CAP 0201/0603 KK]
C169  120pF  [CAP 0402/1005 RF KK]
FL1  TA0409A (420)  [Tai-Saw_7x5p12]
J10  1909763-1  [TECO-1909763-1_V]
J12  1909763-1  [TECO-1909763-1_V]
L6  270nH, 0.17A  [WE-KI_0603]
R84  0mR  [RES 0402/1005 RF - 3-PADS]
R85  0mR  [RES 0402/1005 RF - 3-PADS]
R119  15R  Case/Package: 0603  [RES 0603/1608 RF]
U18  BGA616  Frequency (f): DC-6 GHz  Gain (typ): 17.5 dB  P-1dB (in): +18  Supplier 2: Digi-Key  [INF-SOT343_V]

### Sub-sheets
U_ATT = ATT.SchDoc: Vdd, Ground, RF1, RF2, CTRL (harness ATT_Controle), ~{Q}

### Ports
CTRL (harness ATT_CTRL), GROUND, Out, RF_IN, Vcc_5V_AMP_1, Vcc_5V_ATT_1, ~{Q}

### Nets
AGND: C48.1 C49.2 C161.2 C162.2 C168.2 FL1.1(GND) FL1.2(GND) FL1.3(GND) FL1.5(GND) FL1.6(GND) FL1.7(GND) FL1.8(GND) FL1.9(GND) FL1.11(GND) FL1.12(GND) J10.1 J10.3 J12.1 J12.3 U18.2(GND) U18.4(GND) ; port GROUND, sheet U_ATT/Ground  [project net GND_ATT]
~{Q}: port ~{Q}, sheet U_ATT/~{Q}
Vcc_5V_AMP_1: C161.1 R119.2 ; port Vcc_5V_AMP_1
Vcc_5V_ATT_1: port Vcc_5V_ATT_1, sheet U_ATT/Vdd
NetC48_2: C48.2 C167.2 R85.1
NetC49_1: C49.1 C163.2 U18.1(IN)
NetC162_1: C162.1 L6.2 R119.1
NetC163_1: C163.1 FL1.4(Out)
NetC164_1: R84.2 ; port Out
NetC167_1: C167.1 C168.1 C169.2
NetC169_1: C169.1 ; sheet U_ATT/RF2
NetFL1_10: FL1.10(In) R85.2
NetJ10_2: J10.2 R84.3
NetJ12_2: J12.2 R85.3
NetL6_1: L6.1 R84.1 U18.3(OUT)
NetR45_2: port RF_IN, sheet U_ATT/RF1

### Buses and harness runs
harness port CTRL = sheet U_ATT/CTRL

### Layout directives
net class Single50: NetC48_2, NetC49_1, NetC163_1, NetC164_1, NetC167_1, NetC169_1, NetFL1_10, NetJ10_2, NetJ12_2, NetL6_1, NetR45_2

### Notes on the sheet
- Title
- Size:
- Date:
- A3
- Number:
- Time:
- Revision:
- Sheet
- of
- File:

### Library data of the parts
C48 C49 C168 = Capacitor: Multilayer Ceramic Capacitors MLCC - SMD/SMT 0201 100pF 25volts C0G +/-5%; Manufacturer: Murata; Manufacturer Part Number: GRM0335C1E101JA01D; Tolerance: 5%; Voltage Rating: 25V; Supplier 1: Digi-Key; Supplier Part Number 1: 490-3160-1-ND; RoHS: Yes; Category: Ceramic Capacitors; Stock 1: 2569728; Pricing 1: 1=0,10000, 10=0,01200, 50=0,00660, 100=0,00530, 500=0,00382, 1000=0,00299, 2500=0,00272, 5000=0,00250 (USD); Mount: Surface Mount; Case/Package: 0201; Case Code (Metric): 0603; Case Code (Imperial): 0201; Min Operating Temperature: -55°C; Max Operating Temperature: 125°C; Package Quantity: 15000; Packaging: Tape and Reel; Capacitance: 100pF; Voltage Rating (DC): 25V; Dielectric: C0G; Termination: SMD/SMT; Voltage: 25V; Length: 0.6mm; Height: 0.3mm; Width: 0.012inch; Thickness: 0.013inch; Depth: 0.3mm; Radiation Hardening: No; REACH SVHC: No SVHC; Lead Free: Lead Free; ComponentLink1URL: https://datasheet.ciiva.com/16497/grm0335c1e101ja01-01-16497112.pdf?src-supplier=Future+Electronics; ComponentLink1Description: https://datasheet.ciiva.com/16497/grm0335c1e101ja01-01-16497112.pdf?src-supplier=Future+Electronics; ComponentLink2URL: https://datasheet.ciiva.com/18697/product-18697797.pdf?src-supplier=Digi-Key; ComponentLink2Description: https://datasheet.ciiva.com/18697/product-18697797.pdf?src-supplier=Digi-Key
C161 C162 = Capacitor: Multilayer Ceramic Capacitors MLCC - SMD/SMT 0603 8,200pF 50volts C0G +/-5%; Manufacturer: Murata; Manufacturer Part Number: GRM1885C1H822JA01D; Voltage Rating: 50V; Tolerance: 5%; Supplier 1: Digi-Key; Supplier Part Number 1: 490-11482-1-ND; RoHS: Yes; Category: Ceramic Capacitors; Stock 1: 65615; Pricing 1: 1=0,21000, 10=0,14200, 50=0,08500, 100=0,07170, 500=0,04908, 1000=0,04341 (USD); Mount: Surface Mount; Case Code (Imperial): 0603; Case Code (Metric): 1608; Min Operating Temperature: -55°C; Max Operating Temperature: 125°C; Dielectric: C0G; Capacitance: 8.2nF; Voltage Rating (DC): 50V; Packaging: Tape and Reel; Package Quantity: 4000; Termination: SMD/SMT; Length: 0.063inch; Height: 0.8mm; Width: 0.031inch; Thickness: 0.035inch; ComponentLink1URL: https://datasheet.ciiva.com/29537/partnumbering-e-01-29537913.pdf?src-supplier=Digi-Key; ComponentLink1Description: https://datasheet.ciiva.com/29537/partnumbering-e-01-29537913.pdf?src-supplier=Digi-Key
C163 C167 C169 = Capacitor: as C158 on sheet RF_LANES; Supplier 1: Digi-Key; Supplier Part Number 1: 399-14880-1-ND; RoHS: No; Category: Ceramic Capacitors; Stock 1: 43311; Pricing 1: 1=0,10000, 10=0,04100, 50=0,02260, 100=0,01840, 500=0,01312, 1000=0,01032, 2500=0,00938, 5000=0,00863 (USD); Mount: Surface Mount; Case/Package: 0402; Case Code (Imperial): 0402; Case Code (Metric): 1005; Min Operating Temperature: -55°C; Max Operating Temperature: 125°C; Packaging: Tape and Reel; Capacitance: 120pF; Voltage Rating: 25V; ComponentLink1URL: https://api.kemet.com/component-edge/download/datasheet/C0402C121J3GAC7867.pdf?src-supplier=Digi-Key; ComponentLink1Description: https://api.kemet.com/component-edge/download/datasheet/C0402C121J3GAC7867.pdf?src-supplier=Digi-Key
FL1 = TA0409A (420): SAW filter 420MHz; BW: 10MHz; IL (max): 3.5dB; In Pow (max): 10 dBm; Impedance In, Out: 50 Ohm; Fc: 420MHz
J10 J12 = 1909763-1: as J1 on sheet CLOC_DISTR; DatasheetVersion: Rev. B2; PackageReference: SMD; PackageDescription: 3-Pin Surface Mount Device, Body 2.6 x 2.6 mm; Supplier 1: Newark; Supplier Part Number 1: 62X0488; Supplier 2: Farnell; Supplier Part Number 2: 2781689; Supplier 3: Digi-Key; Supplier Part Number 3: A118077TR-ND; Supplier 4: Digi-Key; Supplier Part Number 4: A118077CT-ND; Supplier 5: Digi-Key; Supplier Part Number 5: A118077DKR-ND; Product Category: RF Connectors / Coaxial Connectors; Packaging: Reel; Product: Connectors; Orientation: Straight; Operating Temperature Range: - 40 C to + 90 C; Factory Pack Quantity: 5000; RoHS: Details; Contact Plating: Gold; Contact Material: Copper Alloy; Mounting Technology: Surface Mount; ComponentLink1Description: Manufacturer URL; ComponentLink1URL: http://www.te.com; ComponentLink2Description: Datasheet; ComponentLink2URL: http://www.te.com/commerce/DocumentDelivery/DDEController?Action=srchrtrv&DocNm=1909763&DocType=Customer+Drawing&DocLang=English
L6 = 744761227A: WE-KI SMT Wire Wound Ceramic Inductor, size 0603, 270nH, 0.17A; Manufacturer: Wurth Elektronik; Q-Factor min.: 30; Inductance Tolerance: +/-5%; DC Resistance max.: 1.8Ohm; Self Resonant Frequency: 1000MHz; ComponentLink1Description: Manufacturer; ComponentLink1URL: http://www.we-online.de; ComponentLink2Description: Datasheet; ComponentLink2URL: https://www.we-online.com/catalog/datasheet/744761227A.pdf; Published Date: April 2020; Rated Current: 0.17A; Packaging: Tape and Reel; Operating Temperature: -40 to +125degC; Manufacturer Part Number: 744761227A; Size: 0603; Inductance: 270nH; Mounting Technology: SMT
R84 R85 = Resistor: YAGEO - RC0402JR-070RL. - RES, THICK FILM, 0R, 0.0625W, 0402; Power Rating: 62.5mW; Tolerance: 5%; Max Power Dissipation: 63mW; Temperature Coefficient: 200ppm/°C; Voltage Rating: 50V; Supplier 1: Digi-Key; Supplier Part Number 1: 311-0.0JRDKR-ND; Manufacturer: Yageo; Manufacturer Part Number: RC0402JR-070RL; RoHS: Yes; Category: Chip SMD Resistors; Stock 1: 19267045; Pricing 1: 1=0,10000, 10=0,01300, 25=0,00920, 50=0,00720, 100=0,00530, 250=0,00400, 500=0,00320, 1000=0,00236, 5000=0,00169 (USD); Case/Package: 0402; Contact Plating: Tin,Matte; Case Code (Metric): 1005; Case Code (Imperial): 0402; Min Operating Temperature: -55°C; Max Operating Temperature: 155°C; Resistance: 0mR; Packaging: Tape and Reel; Composition: Thick Film; Package Quantity: 1; Number of Terminations: 2; Termination: SMD/SMT; Military Standard: Not; Features: Moisture Resistant; Length: 1mm; Height: 0.016inch; Width: 0.02inch; Depth: 0.5mm; Radiation Hardening: No; Lead Free: Lead Free; REACH SVHC: Unknown; ComponentLink1URL: https://datasheet.ciiva.com/2452/pyu-rc0402-51-rohs-l-6-2452608.pdf?src-supplier=Digi-Key; ComponentLink1Description: https://datasheet.ciiva.com/2452/pyu-rc0402-51-rohs-l-6-2452608.pdf?src-supplier=Digi-Key; ComponentLink2URL: https://datasheet.ciiva.com/11808/0900766b80c66297-11808195.pdf?src-supplier=RSComponents; ComponentLink2Description: https://datasheet.ciiva.com/11808/0900766b80c66297-11808195.pdf?src-supplier=RSComponents; ComponentLink3URL: https://datasheet.ciiva.com/2452/pyu-r-int-thick-7-2452609.pdf?src-supplier=Digi-Key; ComponentLink3Description: https://datasheet.ciiva.com/2452/pyu-r-int-thick-7-2452609.pdf?src-supplier=Digi-Key; ComponentLink4URL: https://datasheet.ciiva.com/2452/pyu-r-int-thick-7-2452610.pdf?src-supplier=Digi-Key; ComponentLink4Description: https://datasheet.ciiva.com/2452/pyu-r-int-thick-7-2452610.pdf?src-supplier=Digi-Key; ComponentLink5URL: https://datasheet.ciiva.com/8896/pyu-rc0402-51-rohs-l-6-8896201.pdf?src-supplier=Avnet; ComponentLink5Description: https://datasheet.ciiva.com/8896/pyu-rc0402-51-rohs-l-6-8896201.pdf?src-supplier=Avnet; ComponentLink6URL: https://datasheet.ciiva.com/28386/pyu-rc0402-51-rohs-l-6-28386633.pdf?src-supplier=Avnet+Europe; ComponentLink6Description: https://datasheet.ciiva.com/28386/pyu-rc0402-51-rohs-l-6-28386633.pdf?src-supplier=Avnet+Europe; ComponentLink7URL: https://datasheet.ciiva.com/22747/1018594-22747515.pdf?src-supplier=Element14; ComponentLink7Description: https://datasheet.ciiva.com/22747/1018594-22747515.pdf?src-supplier=Element14; ComponentLink8URL: https://datasheet.ciiva.com/15189/getdatasheetpartid-326379-15189533.pdf?src-supplier=Verical; ComponentLink8Description: https://datasheet.ciiva.com/15189/getdatasheetpartid-326379-15189533.pdf?src-supplier=Verical; ComponentLink9URL: https://datasheet.ciiva.com/7983/1018594-7983535.pdf?src-supplier=Element14; ComponentLink9Description: https://datasheet.ciiva.com/7983/1018594-7983535.pdf?src-supplier=Element14
R119 = Resistor: RES SMD 15 OHM 0.5% 1/16W 0603; Manufacturer: Susumu; Manufacturer Part Number: RR0816Q-150-D; Power Rating: 63mW; Voltage Rating: 75V; Temperature Coefficient: 50ppm/°C; Supplier 1: Digi-Key; Supplier Part Number 1: RR08Q15DCT-ND; RoHS: Yes; Category: Chip SMD Resistors; Stock 1: 15480; Pricing 1: 1=0,10000, 10=0,09300, 100=0,03580, 1000=0,01575, 2500=0,01360 (USD); Number of Pins: 2; Case Code (Imperial): 0603; Case Code (Metric): 1608; Min Operating Temperature: -55°C; Max Operating Temperature: 125°C; Resistance: 15R; Packaging: Tape and Reel; Tolerance: 0.5%; Package Quantity: 1; Termination: SMD/SMT; Resistor Type: Thin Film; Number of Terminations: 2; Max Power Dissipation: 63mW; Voltage Rating (DC): 75V; Length: 1.6mm; Height: 0.4mm; Width: 0.8mm; Depth: 0.8mm; REACH SVHC: Unknown; Lead Free: Lead Free; ComponentLink1URL: https://datasheet.ciiva.com/11820/0900766b80808d64-11820652.pdf?src-supplier=RSComponents; ComponentLink1Description: https://datasheet.ciiva.com/11820/0900766b80808d64-11820652.pdf?src-supplier=RSComponents; ComponentLink2URL: https://datasheet.ciiva.com/2497/rr-data-sheet-2497981.pdf?src-supplier=Digi-Key; ComponentLink2Description: https://datasheet.ciiva.com/2497/rr-data-sheet-2497981.pdf?src-supplier=Digi-Key; ComponentLink3URL: https://datasheet.ciiva.com/2497/rr-data-sheet-2497982.pdf?src-supplier=Digi-Key; ComponentLink3Description: https://datasheet.ciiva.com/2497/rr-data-sheet-2497982.pdf?src-supplier=Digi-Key; ComponentLink4URL: https://datasheet.ciiva.com/2497/rr-data-sheet-2497983.pdf?src-supplier=Digi-Key; ComponentLink4Description: https://datasheet.ciiva.com/2497/rr-data-sheet-2497983.pdf?src-supplier=Digi-Key
U18 = BGA616: Silicon Germanium Broadband MMIC Amplifier, DC-6 GHz, 17.5 dB Gain, SOT343, Green; Manufacturer: Infineon; F (typ): 2.9 dB; Green: yes; I (typ): 60 mA; DatasheetVersion: Rev. 2.1; PackageReference: SOT343; PackageDescription: 4-Pin Small Outline Transistor Package, 1.25 x 2 mm Body; Supplier 1: Mouser; Supplier Part Number 1: N/A; Halogen-free: yes; Mounting Technology: Surface Mount; PartNumber: BGA616; ComponentLink1Description: Manufacturer URL; ComponentLink1URL: http://www.infineon.com/; ComponentLink2Description: Datasheet; ComponentLink2URL: http://www.infineon.com/dgdl/BGA616.pdf?folderId=db3a30431441fb5d0114b654e6581730&fileId=db3a304314dca3890115419102bb163b&location=en.Products.RF.RF_MMIC.CATV___Broadband_Amplifier.DATASHEET.BGA616.pdf; ComponentLink3Description: Package Specification; ComponentLink3URL: http://www.infineon.com/dgdl/SOT343-Package_Overview.pdf?folderId=db3a30431936bc4b0119535155343cba&fileId=db3a30431936bc4b0119535a9f393cd3; Supplier Part Number 2: BGA616H6327XTSA1CT-ND

## Sheet ATT.SchDoc: Attanuator
size A3; SheetNumber: 15; SheetTotal: 17
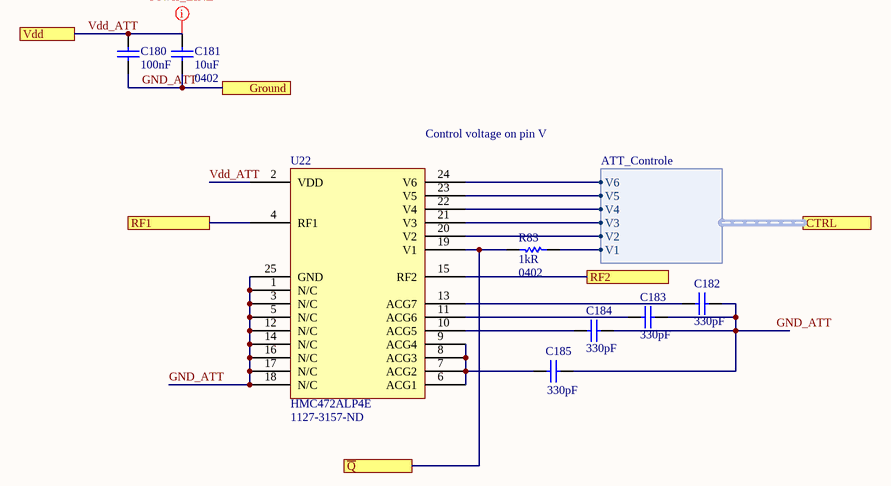
[diagram p7: ATT.SchDoc]

### Parts
C180  100nF  [CAP 0201/0603 KK]
C181  10uF  Case/Package: 0402  [CAP 0402/1005 RF KK]
C182  330pF  [CAP 0402/1005 RF KK]
C183  330pF  [CAP 0402/1005 RF KK]
C184  330pF  [CAP 0402/1005 RF KK]
C185  330pF  [CAP 0402/1005 RF KK]
R83  1kR  Case/Package: 0402  [RES 0402/1005 RF KK]
U22  HMC472ALP4E  Supplier Part Number 1: 1127-3157-ND  [HMC472ALP4E]

### Ports
CTRL (harness ATT_Controle), Ground, RF1, RF2, Vdd, ~{Q}

### Harnesses
ATT_Controle: V1, V2, V3, V4, V5, V6

### Nets
GND_ATT: C180.1 C181.1 C182.2 C183.2 C184.2 C185.2 U22.1(N/C) U22.3(N/C) U22.5(N/C) U22.12(N/C) U22.14(N/C) U22.16(N/C) U22.17(N/C) U22.18(N/C) U22.25(GND) ; port Ground
ATT_TETRA_V1: R83.2 ; port CTRL.V1
ATT_TETRA_V2: U22.20(V2) ; port CTRL.V2
ATT_TETRA_V3: U22.21(V3) ; port CTRL.V3
ATT_TETRA_V4: U22.22(V4) ; port CTRL.V4
ATT_TETRA_V5: U22.23(V5) ; port CTRL.V5
ATT_TETRA_V6: U22.24(V6) ; port CTRL.V6
~{Q}: R83.1 U22.19(V1) ; port ~{Q}
Vdd_ATT: C180.2 C181.2 U22.2(VDD) ; port Vdd  [project net Vcc_5V_ATT_1]
NetC169_1: U22.15(RF2) ; port RF2
NetC182_1: C182.1 U22.13(ACG7)
NetC183_1: C183.1 U22.11(ACG6)
NetC184_1: C184.1 U22.10(ACG5)
NetC185_1: C185.1 U22.6(ACG1) U22.7(ACG2) U22.8(ACG3) U22.9(ACG4)
NetR45_2: U22.4(RF1) ; port RF1

### Layout directives
net class Power_LINE: Vcc_5V_ATT_1

### Notes on the sheet
- (near U22) Control voltage on pin V
- Title
- Size:
- Date:
- A3
- Number:
- Time:
- Revision:
- Sheet
- of
- File:

### Library data of the parts
C180 = Capacitor: as C40 on sheet CLOC_DISTR; Supplier 1: Digi-Key; Supplier Part Number 1: 490-9986-1-ND; Stock 1: 550070; Pricing 1: 1=0.10000, 10=0.05400, 100=0.02430, 500=0.01732, 1000=0.01361, 2500=0.01238, 5000=0.01139 (USD); RoHS: Yes; Mount: Surface Mount; Case/Package: 0201; Weight: 1.2E-05oz; Case Code (Metric): 0603; Case Code (Imperial): 0201; Min Operating Temperature: -55°C; Max Operating Temperature: 85°C; Capacitance: 100nF; Packaging: Tape and Reel; Termination: SMD/SMT; Voltage Rating (DC): 16V; Package Quantity: 15000; Length: 0.024inch; Height: 0.3mm; Width: 0.3mm; Thickness: 0.013inch; ComponentLink1URL: http://www.mouser.com/ds/2/281/c02e-2905.pdf?src-supplier=Mouser; ComponentLink1Description: http://www.mouser.com/ds/2/281/c02e-2905.pdf?src-supplier=Mouser; ComponentLink2URL: http://search.murata.co.jp/Ceramy/image/img/A01X/G101/ENG/GRM033R61C104ME84-01.pdf?src-supplier=Digi-Key; ComponentLink2Description: http://search.murata.co.jp/Ceramy/image/img/A01X/G101/ENG/GRM033R61C104ME84-01.pdf?src-supplier=Digi-Key
C181 = Capacitor: as C35 on sheet CLOC_DISTR; Supplier 1: Digi-Key; Supplier Part Number 1: 490-13211-1-ND; RoHS: Yes; Category: Ceramic Capacitors; Stock 1: 1136490; Pricing 1: 1=0,21000, 10=0,14500, 50=0,08680, 100=0,07330, 500=0,05016, 1000=0,04436, 2500=0,04244, 5000=0,03858 (USD); Mount: Surface Mount; Case Code (Metric): 1005; Case Code (Imperial): 0402; Min Operating Temperature: -55°C; Max Operating Temperature: 85°C; Packaging: Cut Tape; Capacitance: 10uF; Voltage Rating: 6.3V; Features: Soft Termination; Length: 0.039inch; Width: 0.02inch; Thickness: 0.028inch; ComponentLink1URL: http://psearch.en.murata.com/capacitor/product/GRJ155R60J106ME11%23.pdf?src-supplier=Digi-Key; ComponentLink1Description: http://psearch.en.murata.com/capacitor/product/GRJ155R60J106ME11%23.pdf?src-supplier=Digi-Key
C182-C185 = Capacitor: Manufacturer 1: Walsin Technologies; Manufacturer Part Number 1: 0402N331F500CT; Tolerance: 1%; Dielectric: C0G; Supplier 1: Digi-Key; Supplier Part Number 1: 1292-1307-1-ND; Stock 1: 23341; Pricing 1: 1=0.12000, 10=0.09000, 100=0.04030, 500=0.02876, 1000=0.02260, 2500=0.02054, 5000=0.01890 (USD); RoHS: Yes; Case/Package: 0402; Min Operating Temperature: -55°C; Max Operating Temperature: 125°C; Packaging: Tape and Reel; Capacitance: 330pF; Length: 1mm; Depth: 0.5mm; ComponentLink1URL: http://components.arrow.com/part/dataview/0323_06535843?src-supplier=Arrow+Europe; ComponentLink1Description: http://components.arrow.com/part/dataview/0323_06535843?src-supplier=Arrow+Europe; ComponentLink2URL: http://www.passivecomponent.com/indexsea/0402N331F500CT-IN.pdf?src-supplier=Digi-Key; ComponentLink2Description: http://www.passivecomponent.com/indexsea/0402N331F500CT-IN.pdf?src-supplier=Digi-Key
R83 = Resistor: Manufacturer 1: Yageo; Manufacturer Part Number 1: RC0402FR-071KL; Tolerance: 1%; Temperature Coefficient: 100ppm/°C; Power Rating: 62.5mW; Voltage Rating: 50V; Supplier 1: Digi-Key; Supplier Part Number 1: 311-1.00KLRCT-ND; Stock 1: 57541929; Pricing 1: 1=0,10000, 10=0,01600, 100=0,00640, 1000=0,00289, 2500=0,00251, 5000=0,00207 (USD); RoHS: Yes; Number of Pins: 2; Case Code (Imperial): 0402; Case Code (Metric): 1005; Min Operating Temperature: -55°C; Max Operating Temperature: 155°C; Packaging: Tape and Reel; Resistance: 1kR; Composition: Thick Film; Voltage Rating (DC): 50V; Termination: SMD/SMT; Military Standard: Not; Length: 1mm; Height: 0.32mm; Width: 0.5mm; Depth: 0.5mm; REACH SVHC: Unknown; Lead Free: Lead Free; ComponentLink1URL: https://datasheet.ciiva.com/11819/0900766b80c66297-11819477.pdf?src-supplier=RSComponents; ComponentLink1Description: https://datasheet.ciiva.com/11819/0900766b80c66297-11819477.pdf?src-supplier=RSComponents; ComponentLink2URL: https://datasheet.ciiva.com/12666/pyu-rc0402-51-rohs-l-6-r-12666741.pdf?src-supplier=Mouser; ComponentLink2Description: https://datasheet.ciiva.com/12666/pyu-rc0402-51-rohs-l-6-r-12666741.pdf?src-supplier=Mouser; ComponentLink3URL: https://datasheet.ciiva.com/17063/pyu-rc0402-51-rohs-l-6-r-17063193.pdf?src-supplier=Future+Electronics; ComponentLink3Description: https://datasheet.ciiva.com/17063/pyu-rc0402-51-rohs-l-6-r-17063193.pdf?src-supplier=Future+Electronics; ComponentLink4URL: https://datasheet.ciiva.com/22747/1018594-22747513.pdf?src-supplier=Element14; ComponentLink4Description: https://datasheet.ciiva.com/22747/1018594-22747513.pdf?src-supplier=Element14; ComponentLink5URL: https://datasheet.ciiva.com/7849/1018594-7849869.pdf?src-supplier=Element14; ComponentLink5Description: https://datasheet.ciiva.com/7849/1018594-7849869.pdf?src-supplier=Element14; ComponentLink6URL: https://datasheet.ciiva.com/7983/1018594-7983502.pdf?src-supplier=Element14; ComponentLink6Description: https://datasheet.ciiva.com/7983/1018594-7983502.pdf?src-supplier=Element14; ComponentLink7URL: https://datasheet.ciiva.com/7849/1018594-7849871.pdf?src-supplier=Element14; ComponentLink7Description: https://datasheet.ciiva.com/7849/1018594-7849871.pdf?src-supplier=Element14
U22 = HMC472ALP4E: ANALOG DEVICES   HMC472ALP4E   RF ATTENUATOR, 3.8GHZ, 5.5V, HQFN-24; Min Supply Voltage: 4.5V; Attenuation Value: 31.5dB; Impedance: 50R; Max Power Dissipation: 560mW; Number of Bits: 6; Number of Channels: 1; Insertion Loss: 3dB; Operating Supply Voltage: 5V; Supplier 1: Digi-Key; Manufacturer: Analog Devices; Manufacturer Part Number: HMC472ALP4E; Stock 1: 867; Pricing 1: 1 = 7,47000, 10 = 6,84400, 25 = 6,22160, 100 = 5,59940, 250 = 5,13284, 500 = 4,66620, 1000 = 4,19958 (USD); RoHS: Yes; Mount: Surface Mount; Case/Package: SMD/SMT; Number of Pins: 24; Contact Plating: Tin,Matte; Min Operating Temperature: -40°C; Max Operating Temperature: 85°C; Max Supply Voltage: 5.5V; Packaging: Cut Tape; Max Frequency: 3.8GHz; Package Quantity: 50; Min Input Voltage: 4.5V; Max Input Voltage: 5.5V; REACH SVHC: No SVHC; Lead Free: Contains Lead; ComponentLink1URL: http://www.mouser.com/ds/2/609/hmc472a-879296.pdf?src-supplier=Mouser; ComponentLink1Description: http://www.mouser.com/ds/2/609/hmc472a-879296.pdf?src-supplier=Mouser; ComponentLink2URL: http://www.analog.com/media/en/technical-documentation/data-sheets/hmc472a.pdf?src-supplier=Avnet+Asia; ComponentLink2Description: http://www.analog.com/media/en/technical-documentation/data-sheets/hmc472a.pdf?src-supplier=Avnet+Asia; ComponentLink3URL: http://www.farnell.com/datasheets/1868224.pdf?src-supplier=Element14; ComponentLink3Description: http://www.farnell.com/datasheets/1868224.pdf?src-supplier=Element14; ComponentLink4URL: https://www.hittite.com/content/documents/data_sheet/hmc472alp4.pdf?src-supplier=Avnet; ComponentLink4Description: https://www.hittite.com/content/documents/data_sheet/hmc472alp4.pdf?src-supplier=Avnet; ComponentLink5URL: https://www.analog.com/media/en/technical-documentation/data-sheets/hmc472a.pdf?src-supplier=Digi-Key; ComponentLink5Description: https://www.analog.com/media/en/technical-documentation/data-sheets/hmc472a.pdf?src-supplier=Digi-Key